# Altium project IDC_Tester_v1.PrjPcb (part 3 of 3)
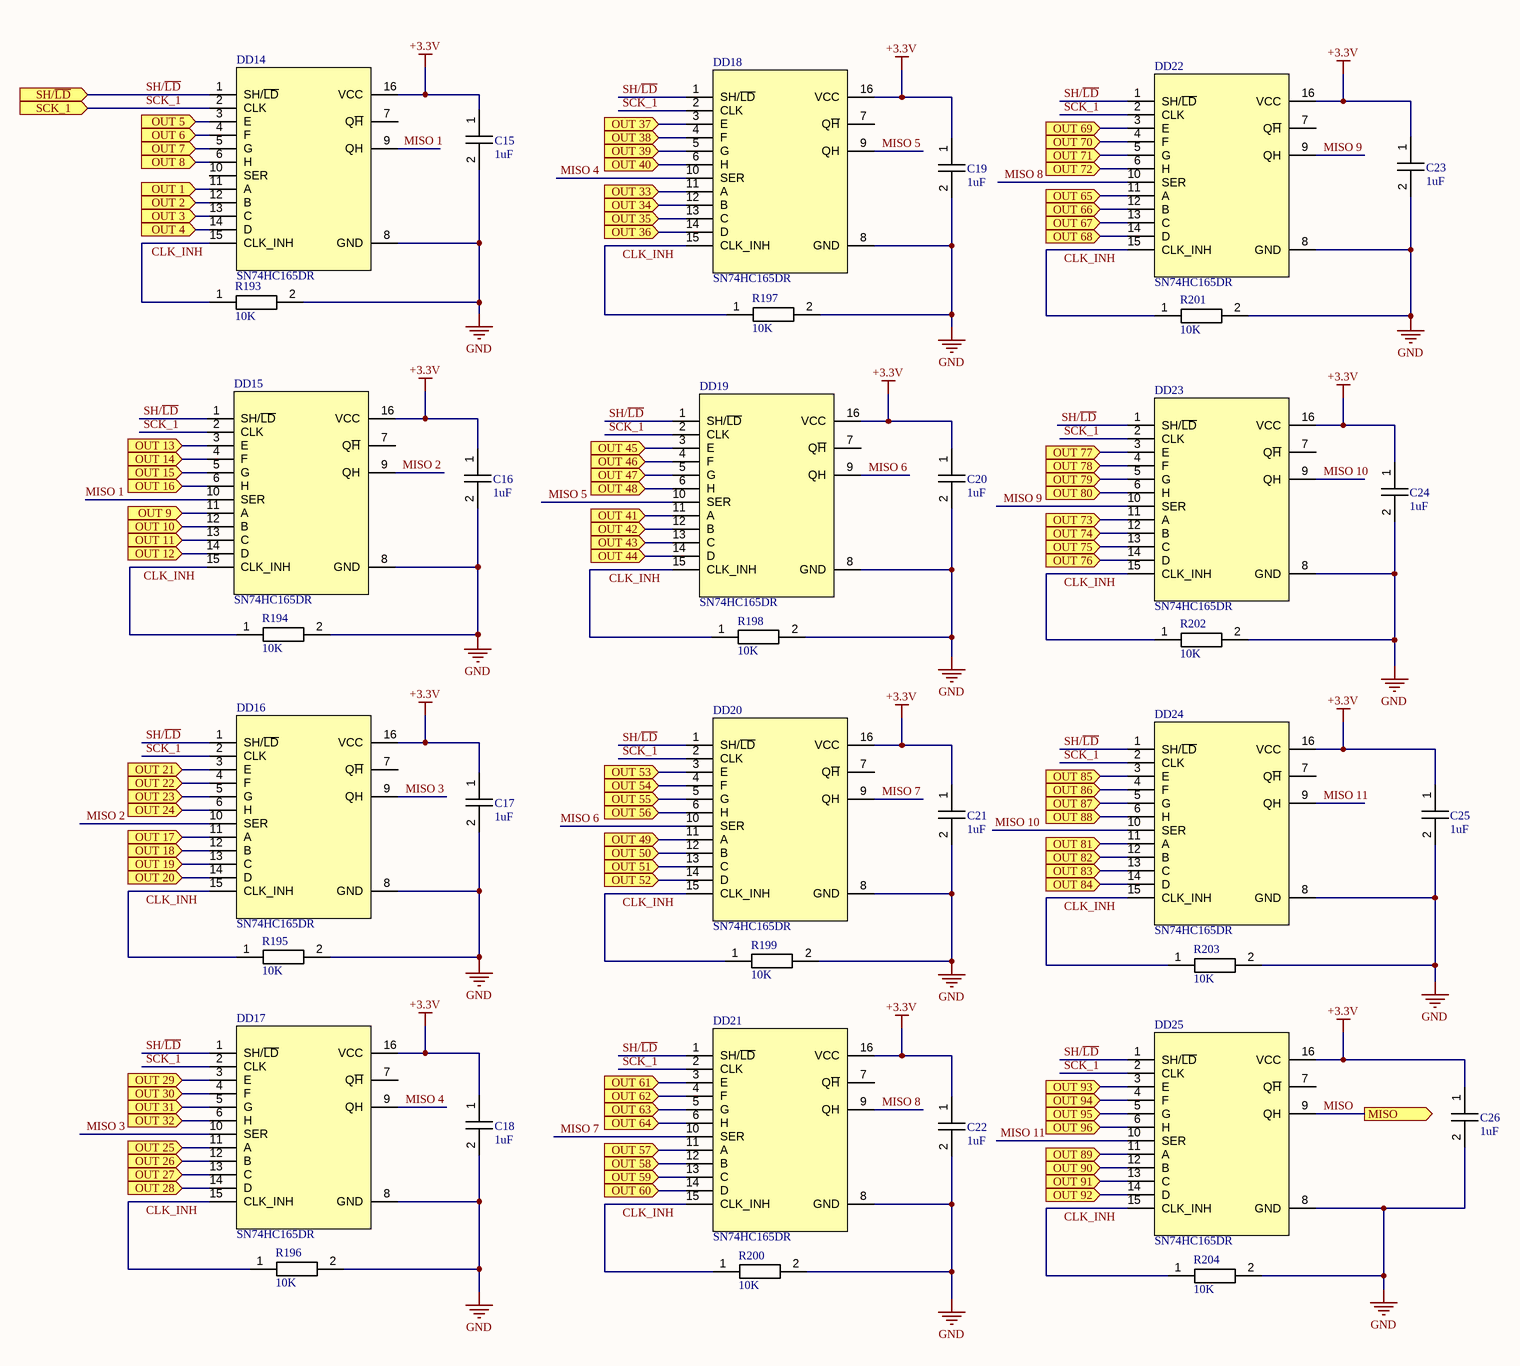
[diagram p10: IDC_Tester_v1_sift_register_input.SchDoc]

## Nets that join several sheets
+3.3V: IDC_Tester_v1_mcu (10 pins), IDC_Tester_v1_sift_register_output (36 pins), IDC_Tester_v1_LED (18 pins), IDC_Tester_v1_LED_2 (18 pins), IDC_Tester_v1_LED_3 (18 pins), IDC_Tester_v1_LED_4 (18 pins), IDC_Tester_v1_LED_5 (18 pins), IDC_Tester_v1_LED_6 (6 pins), IDC_Tester_v1_sift_register_input (24 pins)
GND: IDC_Tester_v1_mcu (18 pins), IDC_Tester_v1_sift_register_output (36 pins), IDC_Tester_v1_LED (36 pins), IDC_Tester_v1_LED_2 (36 pins), IDC_Tester_v1_LED_3 (36 pins), IDC_Tester_v1_LED_4 (36 pins), IDC_Tester_v1_LED_5 (36 pins), IDC_Tester_v1_LED_6 (12 pins), IDC_Tester_v1_sift_register_input (36 pins)
MISO: IDC_Tester_v1_mcu (DD1.3), IDC_Tester_v1_sift_register_input (DD25.9)
MOSI 1: IDC_Tester_v1_mcu (DD1.32), IDC_Tester_v1_sift_register_output (DD2.14)
NetDD14_3: IDC_Tester_v1_connector (X4.5), IDC_Tester_v1_LED (R10.1 VT5.1), IDC_Tester_v1_sift_register_input (DD14.3)
NetDD14_4: IDC_Tester_v1_connector (X4.6), IDC_Tester_v1_LED (R12.1 VT6.1), IDC_Tester_v1_sift_register_input (DD14.4)
NetDD14_5: IDC_Tester_v1_connector (X4.7), IDC_Tester_v1_LED (R14.1 VT7.1), IDC_Tester_v1_sift_register_input (DD14.5)
NetDD14_6: IDC_Tester_v1_connector (X4.8), IDC_Tester_v1_LED (R16.1 VT8.1), IDC_Tester_v1_sift_register_input (DD14.6)
NetDD14_11: IDC_Tester_v1_connector (X4.1), IDC_Tester_v1_LED (R2.1 VT1.1), IDC_Tester_v1_sift_register_input (DD14.11)
NetDD14_12: IDC_Tester_v1_connector (X4.2), IDC_Tester_v1_LED (R4.1 VT2.1), IDC_Tester_v1_sift_register_input (DD14.12)
NetDD14_13: IDC_Tester_v1_connector (X4.3), IDC_Tester_v1_LED (R6.1 VT3.1), IDC_Tester_v1_sift_register_input (DD14.13)
NetDD14_14: IDC_Tester_v1_connector (X4.4), IDC_Tester_v1_LED (R8.1 VT4.1), IDC_Tester_v1_sift_register_input (DD14.14)
NetDD15_3: IDC_Tester_v1_connector (X4.13), IDC_Tester_v1_LED (R26.1 VT13.1), IDC_Tester_v1_sift_register_input (DD15.3)
NetDD15_4: IDC_Tester_v1_connector (X4.14), IDC_Tester_v1_LED (R28.1 VT14.1), IDC_Tester_v1_sift_register_input (DD15.4)
NetDD15_5: IDC_Tester_v1_connector (X4.15), IDC_Tester_v1_LED (R30.1 VT15.1), IDC_Tester_v1_sift_register_input (DD15.5)
NetDD15_6: IDC_Tester_v1_connector (X4.16), IDC_Tester_v1_LED (R32.1 VT16.1), IDC_Tester_v1_sift_register_input (DD15.6)
NetDD15_11: IDC_Tester_v1_connector (X4.9), IDC_Tester_v1_LED (R18.1 VT9.1), IDC_Tester_v1_sift_register_input (DD15.11)
NetDD15_12: IDC_Tester_v1_connector (X4.10), IDC_Tester_v1_LED (R20.1 VT10.1), IDC_Tester_v1_sift_register_input (DD15.12)
NetDD15_13: IDC_Tester_v1_connector (X4.11), IDC_Tester_v1_LED (R22.1 VT11.1), IDC_Tester_v1_sift_register_input (DD15.13)
NetDD15_14: IDC_Tester_v1_connector (X4.12), IDC_Tester_v1_LED (R24.1 VT12.1), IDC_Tester_v1_sift_register_input (DD15.14)
NetDD16_3: IDC_Tester_v1_connector (X4.21), IDC_Tester_v1_LED_2 (R42.1 VT21.1), IDC_Tester_v1_sift_register_input (DD16.3)
NetDD16_4: IDC_Tester_v1_connector (X4.22), IDC_Tester_v1_LED_2 (R44.1 VT22.1), IDC_Tester_v1_sift_register_input (DD16.4)
NetDD16_5: IDC_Tester_v1_connector (X4.23), IDC_Tester_v1_LED_2 (R46.1 VT23.1), IDC_Tester_v1_sift_register_input (DD16.5)
NetDD16_6: IDC_Tester_v1_connector (X4.24), IDC_Tester_v1_LED_2 (R48.1 VT24.1), IDC_Tester_v1_sift_register_input (DD16.6)
NetDD16_11: IDC_Tester_v1_connector (X4.17), IDC_Tester_v1_LED (R34.1 VT17.1), IDC_Tester_v1_sift_register_input (DD16.11)
NetDD16_12: IDC_Tester_v1_connector (X4.18), IDC_Tester_v1_LED (R36.1 VT18.1), IDC_Tester_v1_sift_register_input (DD16.12)
NetDD16_13: IDC_Tester_v1_connector (X4.19), IDC_Tester_v1_LED_2 (R38.1 VT19.1), IDC_Tester_v1_sift_register_input (DD16.13)
NetDD16_14: IDC_Tester_v1_connector (X4.20), IDC_Tester_v1_LED_2 (R40.1 VT20.1), IDC_Tester_v1_sift_register_input (DD16.14)
NetDD17_3: IDC_Tester_v1_connector (X4.29), IDC_Tester_v1_LED_2 (R58.1 VT29.1), IDC_Tester_v1_sift_register_input (DD17.3)
NetDD17_4: IDC_Tester_v1_connector (X4.30), IDC_Tester_v1_LED_2 (R60.1 VT30.1), IDC_Tester_v1_sift_register_input (DD17.4)
NetDD17_5: IDC_Tester_v1_connector (X4.31), IDC_Tester_v1_LED_2 (R62.1 VT31.1), IDC_Tester_v1_sift_register_input (DD17.5)
NetDD17_6: IDC_Tester_v1_connector (X4.32), IDC_Tester_v1_LED_2 (R64.1 VT32.1), IDC_Tester_v1_sift_register_input (DD17.6)
NetDD17_11: IDC_Tester_v1_connector (X4.25), IDC_Tester_v1_LED_2 (R50.1 VT25.1), IDC_Tester_v1_sift_register_input (DD17.11)
NetDD17_12: IDC_Tester_v1_connector (X4.26), IDC_Tester_v1_LED_2 (R52.1 VT26.1), IDC_Tester_v1_sift_register_input (DD17.12)
NetDD17_13: IDC_Tester_v1_connector (X4.27), IDC_Tester_v1_LED_2 (R54.1 VT27.1), IDC_Tester_v1_sift_register_input (DD17.13)
NetDD17_14: IDC_Tester_v1_connector (X4.28), IDC_Tester_v1_LED_2 (R56.1 VT28.1), IDC_Tester_v1_sift_register_input (DD17.14)
NetDD18_3: IDC_Tester_v1_connector (X4.37), IDC_Tester_v1_LED_3 (R74.1 VT37.1), IDC_Tester_v1_sift_register_input (DD18.3)
NetDD18_4: IDC_Tester_v1_connector (X4.38), IDC_Tester_v1_LED_3 (R76.1 VT38.1), IDC_Tester_v1_sift_register_input (DD18.4)
NetDD18_5: IDC_Tester_v1_connector (X4.39), IDC_Tester_v1_LED_3 (R78.1 VT39.1), IDC_Tester_v1_sift_register_input (DD18.5)
NetDD18_6: IDC_Tester_v1_connector (X4.40), IDC_Tester_v1_LED_3 (R80.1 VT40.1), IDC_Tester_v1_sift_register_input (DD18.6)
NetDD18_11: IDC_Tester_v1_connector (X4.33), IDC_Tester_v1_LED_2 (R66.1 VT33.1), IDC_Tester_v1_sift_register_input (DD18.11)
NetDD18_12: IDC_Tester_v1_connector (X4.34), IDC_Tester_v1_LED_2 (R68.1 VT34.1), IDC_Tester_v1_sift_register_input (DD18.12)
NetDD18_13: IDC_Tester_v1_connector (X4.35), IDC_Tester_v1_LED_2 (R70.1 VT35.1), IDC_Tester_v1_sift_register_input (DD18.13)
NetDD18_14: IDC_Tester_v1_connector (X4.36), IDC_Tester_v1_LED_2 (R72.1 VT36.1), IDC_Tester_v1_sift_register_input (DD18.14)
NetDD19_3: IDC_Tester_v1_connector (X5.5), IDC_Tester_v1_LED_3 (R90.1 VT45.1), IDC_Tester_v1_sift_register_input (DD19.3)
NetDD19_4: IDC_Tester_v1_connector (X5.6), IDC_Tester_v1_LED_3 (R92.1 VT46.1), IDC_Tester_v1_sift_register_input (DD19.4)
NetDD19_5: IDC_Tester_v1_connector (X5.7), IDC_Tester_v1_LED_3 (R94.1 VT47.1), IDC_Tester_v1_sift_register_input (DD19.5)
NetDD19_6: IDC_Tester_v1_connector (X5.8), IDC_Tester_v1_LED_3 (R96.1 VT48.1), IDC_Tester_v1_sift_register_input (DD19.6)
NetDD19_11: IDC_Tester_v1_connector (X5.1), IDC_Tester_v1_LED_3 (R82.1 VT41.1), IDC_Tester_v1_sift_register_input (DD19.11)
NetDD19_12: IDC_Tester_v1_connector (X5.2), IDC_Tester_v1_LED_3 (R84.1 VT42.1), IDC_Tester_v1_sift_register_input (DD19.12)
NetDD19_13: IDC_Tester_v1_connector (X5.3), IDC_Tester_v1_LED_3 (R86.1 VT43.1), IDC_Tester_v1_sift_register_input (DD19.13)
NetDD19_14: IDC_Tester_v1_connector (X5.4), IDC_Tester_v1_LED_3 (R88.1 VT44.1), IDC_Tester_v1_sift_register_input (DD19.14)
NetDD20_3: IDC_Tester_v1_connector (X5.13), IDC_Tester_v1_LED_3 (R106.1 VT53.1), IDC_Tester_v1_sift_register_input (DD20.3)
NetDD20_4: IDC_Tester_v1_connector (X5.14), IDC_Tester_v1_LED_3 (R108.1 VT54.1), IDC_Tester_v1_sift_register_input (DD20.4)
NetDD20_5: IDC_Tester_v1_connector (X5.15), IDC_Tester_v1_LED_4 (R110.1 VT55.1), IDC_Tester_v1_sift_register_input (DD20.5)
NetDD20_6: IDC_Tester_v1_connector (X5.16), IDC_Tester_v1_LED_4 (R112.1 VT56.1), IDC_Tester_v1_sift_register_input (DD20.6)
NetDD20_11: IDC_Tester_v1_connector (X5.9), IDC_Tester_v1_LED_3 (R98.1 VT49.1), IDC_Tester_v1_sift_register_input (DD20.11)
NetDD20_12: IDC_Tester_v1_connector (X5.10), IDC_Tester_v1_LED_3 (R100.1 VT50.1), IDC_Tester_v1_sift_register_input (DD20.12)
NetDD20_13: IDC_Tester_v1_connector (X5.11), IDC_Tester_v1_LED_3 (R102.1 VT51.1), IDC_Tester_v1_sift_register_input (DD20.13)
NetDD20_14: IDC_Tester_v1_connector (X5.12), IDC_Tester_v1_LED_3 (R104.1 VT52.1), IDC_Tester_v1_sift_register_input (DD20.14)
NetDD21_3: IDC_Tester_v1_connector (X5.21), IDC_Tester_v1_LED_4 (R122.1 VT61.1), IDC_Tester_v1_sift_register_input (DD21.3)
NetDD21_4: IDC_Tester_v1_connector (X5.22), IDC_Tester_v1_LED_4 (R124.1 VT62.1), IDC_Tester_v1_sift_register_input (DD21.4)
NetDD21_5: IDC_Tester_v1_connector (X5.23), IDC_Tester_v1_LED_4 (R126.1 VT63.1), IDC_Tester_v1_sift_register_input (DD21.5)
NetDD21_6: IDC_Tester_v1_connector (X5.24), IDC_Tester_v1_LED_4 (R128.1 VT64.1), IDC_Tester_v1_sift_register_input (DD21.6)
NetDD21_11: IDC_Tester_v1_connector (X5.17), IDC_Tester_v1_LED_4 (R114.1 VT57.1), IDC_Tester_v1_sift_register_input (DD21.11)
NetDD21_12: IDC_Tester_v1_connector (X5.18), IDC_Tester_v1_LED_4 (R116.1 VT58.1), IDC_Tester_v1_sift_register_input (DD21.12)
NetDD21_13: IDC_Tester_v1_connector (X5.19), IDC_Tester_v1_LED_4 (R118.1 VT59.1), IDC_Tester_v1_sift_register_input (DD21.13)
NetDD21_14: IDC_Tester_v1_connector (X5.20), IDC_Tester_v1_LED_4 (R120.1 VT60.1), IDC_Tester_v1_sift_register_input (DD21.14)
NetDD22_3: IDC_Tester_v1_connector (X5.29), IDC_Tester_v1_LED_4 (R138.1 VT69.1), IDC_Tester_v1_sift_register_input (DD22.3)
NetDD22_4: IDC_Tester_v1_connector (X5.30), IDC_Tester_v1_LED_4 (R140.1 VT70.1), IDC_Tester_v1_sift_register_input (DD22.4)
NetDD22_5: IDC_Tester_v1_connector (X5.31), IDC_Tester_v1_LED_4 (R142.1 VT71.1), IDC_Tester_v1_sift_register_input (DD22.5)
NetDD22_6: IDC_Tester_v1_connector (X5.32), IDC_Tester_v1_LED_4 (R144.1 VT72.1), IDC_Tester_v1_sift_register_input (DD22.6)
NetDD22_11: IDC_Tester_v1_connector (X5.25), IDC_Tester_v1_LED_4 (R130.1 VT65.1), IDC_Tester_v1_sift_register_input (DD22.11)
NetDD22_12: IDC_Tester_v1_connector (X5.26), IDC_Tester_v1_LED_4 (R132.1 VT66.1), IDC_Tester_v1_sift_register_input (DD22.12)
NetDD22_13: IDC_Tester_v1_connector (X5.27), IDC_Tester_v1_LED_4 (R134.1 VT67.1), IDC_Tester_v1_sift_register_input (DD22.13)
NetDD22_14: IDC_Tester_v1_connector (X5.28), IDC_Tester_v1_LED_4 (R136.1 VT68.1), IDC_Tester_v1_sift_register_input (DD22.14)
NetDD23_3: IDC_Tester_v1_connector (X5.37), IDC_Tester_v1_LED_5 (R154.1 VT77.1), IDC_Tester_v1_sift_register_input (DD23.3)
NetDD23_4: IDC_Tester_v1_connector (X5.38), IDC_Tester_v1_LED_5 (R156.1 VT78.1), IDC_Tester_v1_sift_register_input (DD23.4)
NetDD23_5: IDC_Tester_v1_connector (X5.39), IDC_Tester_v1_LED_5 (R158.1 VT79.1), IDC_Tester_v1_sift_register_input (DD23.5)
NetDD23_6: IDC_Tester_v1_connector (X5.40), IDC_Tester_v1_LED_5 (R160.1 VT80.1), IDC_Tester_v1_sift_register_input (DD23.6)
NetDD23_11: IDC_Tester_v1_connector (X5.33), IDC_Tester_v1_LED_5 (R146.1 VT73.1), IDC_Tester_v1_sift_register_input (DD23.11)
NetDD23_12: IDC_Tester_v1_connector (X5.34), IDC_Tester_v1_LED_5 (R148.1 VT74.1), IDC_Tester_v1_sift_register_input (DD23.12)
NetDD23_13: IDC_Tester_v1_connector (X5.35), IDC_Tester_v1_LED_5 (R150.1 VT75.1), IDC_Tester_v1_sift_register_input (DD23.13)
NetDD23_14: IDC_Tester_v1_connector (X5.36), IDC_Tester_v1_LED_5 (R152.1 VT76.1), IDC_Tester_v1_sift_register_input (DD23.14)
NetDD24_3: IDC_Tester_v1_connector (X6.5), IDC_Tester_v1_LED_5 (R170.1 VT85.1), IDC_Tester_v1_sift_register_input (DD24.3)
NetDD24_4: IDC_Tester_v1_connector (X6.6), IDC_Tester_v1_LED_5 (R172.1 VT86.1), IDC_Tester_v1_sift_register_input (DD24.4)
NetDD24_5: IDC_Tester_v1_connector (X6.7), IDC_Tester_v1_LED_5 (R174.1 VT87.1), IDC_Tester_v1_sift_register_input (DD24.5)
NetDD24_6: IDC_Tester_v1_connector (X6.8), IDC_Tester_v1_LED_5 (R176.1 VT88.1), IDC_Tester_v1_sift_register_input (DD24.6)
NetDD24_11: IDC_Tester_v1_connector (X6.1), IDC_Tester_v1_LED_5 (R162.1 VT81.1), IDC_Tester_v1_sift_register_input (DD24.11)
NetDD24_12: IDC_Tester_v1_connector (X6.2), IDC_Tester_v1_LED_5 (R164.1 VT82.1), IDC_Tester_v1_sift_register_input (DD24.12)
NetDD24_13: IDC_Tester_v1_connector (X6.3), IDC_Tester_v1_LED_5 (R166.1 VT83.1), IDC_Tester_v1_sift_register_input (DD24.13)
NetDD24_14: IDC_Tester_v1_connector (X6.4), IDC_Tester_v1_LED_5 (R168.1 VT84.1), IDC_Tester_v1_sift_register_input (DD24.14)
NetDD25_3: IDC_Tester_v1_connector (X6.13), IDC_Tester_v1_LED_6 (R186.1 VT93.1), IDC_Tester_v1_sift_register_input (DD25.3)
NetDD25_4: IDC_Tester_v1_connector (X6.14), IDC_Tester_v1_LED_6 (R188.1 VT94.1), IDC_Tester_v1_sift_register_input (DD25.4)
NetDD25_5: IDC_Tester_v1_connector (X6.15), IDC_Tester_v1_LED_6 (R190.1 VT95.1), IDC_Tester_v1_sift_register_input (DD25.5)
NetDD25_6: IDC_Tester_v1_connector (X6.16), IDC_Tester_v1_LED_6 (R192.1 VT96.1), IDC_Tester_v1_sift_register_input (DD25.6)
NetDD25_11: IDC_Tester_v1_connector (X6.9), IDC_Tester_v1_LED_5 (R178.1 VT89.1), IDC_Tester_v1_sift_register_input (DD25.11)
NetDD25_12: IDC_Tester_v1_connector (X6.10), IDC_Tester_v1_LED_5 (R180.1 VT90.1), IDC_Tester_v1_sift_register_input (DD25.12)
NetDD25_13: IDC_Tester_v1_connector (X6.11), IDC_Tester_v1_LED_6 (R182.1 VT91.1), IDC_Tester_v1_sift_register_input (DD25.13)
NetDD25_14: IDC_Tester_v1_connector (X6.12), IDC_Tester_v1_LED_6 (R184.1 VT92.1), IDC_Tester_v1_sift_register_input (DD25.14)
NetR217_2: IDC_Tester_v1_sift_register_output (R217.2), IDC_Tester_v1_connector (X1.1)
NetR218_2: IDC_Tester_v1_sift_register_output (R218.2), IDC_Tester_v1_connector (X1.2)
NetR219_2: IDC_Tester_v1_sift_register_output (R219.2), IDC_Tester_v1_connector (X1.3)
NetR220_2: IDC_Tester_v1_sift_register_output (R220.2), IDC_Tester_v1_connector (X1.4)
NetR221_2: IDC_Tester_v1_sift_register_output (R221.2), IDC_Tester_v1_connector (X1.5)
NetR222_2: IDC_Tester_v1_sift_register_output (R222.2), IDC_Tester_v1_connector (X1.6)
NetR223_2: IDC_Tester_v1_sift_register_output (R223.2), IDC_Tester_v1_connector (X1.7)
NetR224_2: IDC_Tester_v1_sift_register_output (R224.2), IDC_Tester_v1_connector (X1.8)
NetR225_2: IDC_Tester_v1_sift_register_output (R225.2), IDC_Tester_v1_connector (X1.9)
NetR226_2: IDC_Tester_v1_sift_register_output (R226.2), IDC_Tester_v1_connector (X1.10)
NetR227_2: IDC_Tester_v1_sift_register_output (R227.2), IDC_Tester_v1_connector (X1.11)
NetR228_2: IDC_Tester_v1_sift_register_output (R228.2), IDC_Tester_v1_connector (X1.12)
NetR229_2: IDC_Tester_v1_sift_register_output (R229.2), IDC_Tester_v1_connector (X1.13)
NetR230_2: IDC_Tester_v1_sift_register_output (R230.2), IDC_Tester_v1_connector (X1.14)
NetR231_2: IDC_Tester_v1_sift_register_output (R231.2), IDC_Tester_v1_connector (X1.15)
NetR232_2: IDC_Tester_v1_sift_register_output (R232.2), IDC_Tester_v1_connector (X1.16)
NetR233_2: IDC_Tester_v1_sift_register_output (R233.2), IDC_Tester_v1_connector (X1.17)
NetR234_2: IDC_Tester_v1_sift_register_output (R234.2), IDC_Tester_v1_connector (X1.18)
NetR235_2: IDC_Tester_v1_sift_register_output (R235.2), IDC_Tester_v1_connector (X1.19)
NetR236_2: IDC_Tester_v1_sift_register_output (R236.2), IDC_Tester_v1_connector (X1.20)
NetR237_2: IDC_Tester_v1_sift_register_output (R237.2), IDC_Tester_v1_connector (X1.21)
NetR238_2: IDC_Tester_v1_sift_register_output (R238.2), IDC_Tester_v1_connector (X1.22)
NetR239_2: IDC_Tester_v1_sift_register_output (R239.2), IDC_Tester_v1_connector (X1.23)
NetR240_2: IDC_Tester_v1_sift_register_output (R240.2), IDC_Tester_v1_connector (X1.24)
NetR241_2: IDC_Tester_v1_sift_register_output (R241.2), IDC_Tester_v1_connector (X1.25)
NetR242_2: IDC_Tester_v1_sift_register_output (R242.2), IDC_Tester_v1_connector (X1.26)
NetR243_2: IDC_Tester_v1_sift_register_output (R243.2), IDC_Tester_v1_connector (X1.27)
NetR244_2: IDC_Tester_v1_sift_register_output (R244.2), IDC_Tester_v1_connector (X1.28)
NetR245_2: IDC_Tester_v1_sift_register_output (R245.2), IDC_Tester_v1_connector (X1.29)
NetR246_2: IDC_Tester_v1_sift_register_output (R246.2), IDC_Tester_v1_connector (X1.30)
NetR247_2: IDC_Tester_v1_sift_register_output (R247.2), IDC_Tester_v1_connector (X1.31)
NetR248_2: IDC_Tester_v1_sift_register_output (R248.2), IDC_Tester_v1_connector (X1.32)
NetR249_2: IDC_Tester_v1_sift_register_output (R249.2), IDC_Tester_v1_connector (X1.33)
NetR250_2: IDC_Tester_v1_sift_register_output (R250.2), IDC_Tester_v1_connector (X1.34)
NetR251_2: IDC_Tester_v1_sift_register_output (R251.2), IDC_Tester_v1_connector (X1.35)
NetR252_2: IDC_Tester_v1_sift_register_output (R252.2), IDC_Tester_v1_connector (X1.36)
NetR253_2: IDC_Tester_v1_sift_register_output (R253.2), IDC_Tester_v1_connector (X1.37)
NetR254_2: IDC_Tester_v1_sift_register_output (R254.2), IDC_Tester_v1_connector (X1.38)
NetR255_2: IDC_Tester_v1_sift_register_output (R255.2), IDC_Tester_v1_connector (X1.39)
NetR256_2: IDC_Tester_v1_sift_register_output (R256.2), IDC_Tester_v1_connector (X1.40)
NetR257_2: IDC_Tester_v1_sift_register_output (R257.2), IDC_Tester_v1_connector (X2.1)
NetR258_2: IDC_Tester_v1_sift_register_output (R258.2), IDC_Tester_v1_connector (X2.2)
NetR259_2: IDC_Tester_v1_sift_register_output (R259.2), IDC_Tester_v1_connector (X2.3)
NetR260_2: IDC_Tester_v1_sift_register_output (R260.2), IDC_Tester_v1_connector (X2.4)
NetR261_2: IDC_Tester_v1_sift_register_output (R261.2), IDC_Tester_v1_connector (X2.5)
NetR262_2: IDC_Tester_v1_sift_register_output (R262.2), IDC_Tester_v1_connector (X2.6)
NetR263_2: IDC_Tester_v1_sift_register_output (R263.2), IDC_Tester_v1_connector (X2.7)
NetR264_2: IDC_Tester_v1_sift_register_output (R264.2), IDC_Tester_v1_connector (X2.8)
NetR265_2: IDC_Tester_v1_sift_register_output (R265.2), IDC_Tester_v1_connector (X2.9)
NetR266_2: IDC_Tester_v1_sift_register_output (R266.2), IDC_Tester_v1_connector (X2.10)
NetR267_2: IDC_Tester_v1_sift_register_output (R267.2), IDC_Tester_v1_connector (X2.11)
NetR268_2: IDC_Tester_v1_sift_register_output (R268.2), IDC_Tester_v1_connector (X2.12)
NetR269_2: IDC_Tester_v1_sift_register_output (R269.2), IDC_Tester_v1_connector (X2.13)
NetR270_2: IDC_Tester_v1_sift_register_output (R270.2), IDC_Tester_v1_connector (X2.14)
NetR271_2: IDC_Tester_v1_sift_register_output (R271.2), IDC_Tester_v1_connector (X2.15)
NetR272_2: IDC_Tester_v1_sift_register_output (R272.2), IDC_Tester_v1_connector (X2.16)
NetR273_2: IDC_Tester_v1_sift_register_output (R273.2), IDC_Tester_v1_connector (X2.17)
NetR274_2: IDC_Tester_v1_sift_register_output (R274.2), IDC_Tester_v1_connector (X2.18)
NetR275_2: IDC_Tester_v1_sift_register_output (R275.2), IDC_Tester_v1_connector (X2.19)
NetR276_2: IDC_Tester_v1_sift_register_output (R276.2), IDC_Tester_v1_connector (X2.20)
NetR277_2: IDC_Tester_v1_sift_register_output (R277.2), IDC_Tester_v1_connector (X2.21)
NetR278_2: IDC_Tester_v1_sift_register_output (R278.2), IDC_Tester_v1_connector (X2.22)
NetR279_2: IDC_Tester_v1_sift_register_output (R279.2), IDC_Tester_v1_connector (X2.23)
NetR280_2: IDC_Tester_v1_sift_register_output (R280.2), IDC_Tester_v1_connector (X2.24)
NetR281_2: IDC_Tester_v1_sift_register_output (R281.2), IDC_Tester_v1_connector (X2.25)
NetR282_2: IDC_Tester_v1_sift_register_output (R282.2), IDC_Tester_v1_connector (X2.26)
NetR283_2: IDC_Tester_v1_sift_register_output (R283.2), IDC_Tester_v1_connector (X2.27)
NetR284_2: IDC_Tester_v1_sift_register_output (R284.2), IDC_Tester_v1_connector (X2.28)
NetR285_2: IDC_Tester_v1_sift_register_output (R285.2), IDC_Tester_v1_connector (X2.29)
NetR286_2: IDC_Tester_v1_sift_register_output (R286.2), IDC_Tester_v1_connector (X2.30)
NetR287_2: IDC_Tester_v1_sift_register_output (R287.2), IDC_Tester_v1_connector (X2.31)
NetR288_2: IDC_Tester_v1_sift_register_output (R288.2), IDC_Tester_v1_connector (X2.32)
NetR289_2: IDC_Tester_v1_sift_register_output (R289.2), IDC_Tester_v1_connector (X2.33)
NetR290_2: IDC_Tester_v1_sift_register_output (R290.2), IDC_Tester_v1_connector (X2.34)
NetR291_2: IDC_Tester_v1_sift_register_output (R291.2), IDC_Tester_v1_connector (X2.35)
NetR292_2: IDC_Tester_v1_sift_register_output (R292.2), IDC_Tester_v1_connector (X2.36)
NetR293_2: IDC_Tester_v1_sift_register_output (R293.2), IDC_Tester_v1_connector (X2.37)
NetR294_2: IDC_Tester_v1_sift_register_output (R294.2), IDC_Tester_v1_connector (X2.38)
NetR295_2: IDC_Tester_v1_sift_register_output (R295.2), IDC_Tester_v1_connector (X2.39)
NetR296_2: IDC_Tester_v1_sift_register_output (R296.2), IDC_Tester_v1_connector (X2.40)
NetR297_2: IDC_Tester_v1_sift_register_output (R297.2), IDC_Tester_v1_connector (X3.1)
NetR298_2: IDC_Tester_v1_sift_register_output (R298.2), IDC_Tester_v1_connector (X3.2)
NetR299_2: IDC_Tester_v1_sift_register_output (R299.2), IDC_Tester_v1_connector (X3.3)
NetR300_2: IDC_Tester_v1_sift_register_output (R300.2), IDC_Tester_v1_connector (X3.4)
NetR301_2: IDC_Tester_v1_sift_register_output (R301.2), IDC_Tester_v1_connector (X3.5)
NetR302_2: IDC_Tester_v1_sift_register_output (R302.2), IDC_Tester_v1_connector (X3.6)
NetR303_2: IDC_Tester_v1_sift_register_output (R303.2), IDC_Tester_v1_connector (X3.7)
NetR304_2: IDC_Tester_v1_sift_register_output (R304.2), IDC_Tester_v1_connector (X3.8)
NetR305_2: IDC_Tester_v1_sift_register_output (R305.2), IDC_Tester_v1_connector (X3.9)
NetR306_2: IDC_Tester_v1_sift_register_output (R306.2), IDC_Tester_v1_connector (X3.10)
NetR307_2: IDC_Tester_v1_sift_register_output (R307.2), IDC_Tester_v1_connector (X3.11)
NetR308_2: IDC_Tester_v1_sift_register_output (R308.2), IDC_Tester_v1_connector (X3.12)
NetR309_2: IDC_Tester_v1_sift_register_output (R309.2), IDC_Tester_v1_connector (X3.13)
NetR310_2: IDC_Tester_v1_sift_register_output (R310.2), IDC_Tester_v1_connector (X3.14)
NetR311_2: IDC_Tester_v1_sift_register_output (R311.2), IDC_Tester_v1_connector (X3.15)
NetR312_2: IDC_Tester_v1_sift_register_output (R312.2), IDC_Tester_v1_connector (X3.16)
~{OE}: IDC_Tester_v1_mcu (DD1.16), IDC_Tester_v1_sift_register_output (24 pins)
SCK: IDC_Tester_v1_mcu (DD1.30), IDC_Tester_v1_sift_register_output (12 pins)
SCK_1: IDC_Tester_v1_mcu (DD1.2), IDC_Tester_v1_sift_register_input (12 pins)
SH/~{LD}: IDC_Tester_v1_mcu (DD1.5), IDC_Tester_v1_sift_register_input (12 pins)
ST_CP: IDC_Tester_v1_mcu (DD1.17), IDC_Tester_v1_sift_register_output (12 pins)